# EasyEDA Pro project ProPrj_装配排查_2026-04-26.epro, schematic Schematic2
Assembly Variant: Basic; Board Name: Board2; Create Date: 2026-04-22; Page Name: P1; Project Name: 装配排查; Schematic Name: Schematic2; Update Date: 2026-04-22; Company: 嘉立创EDA; Page Size: A4; Version: V1.0
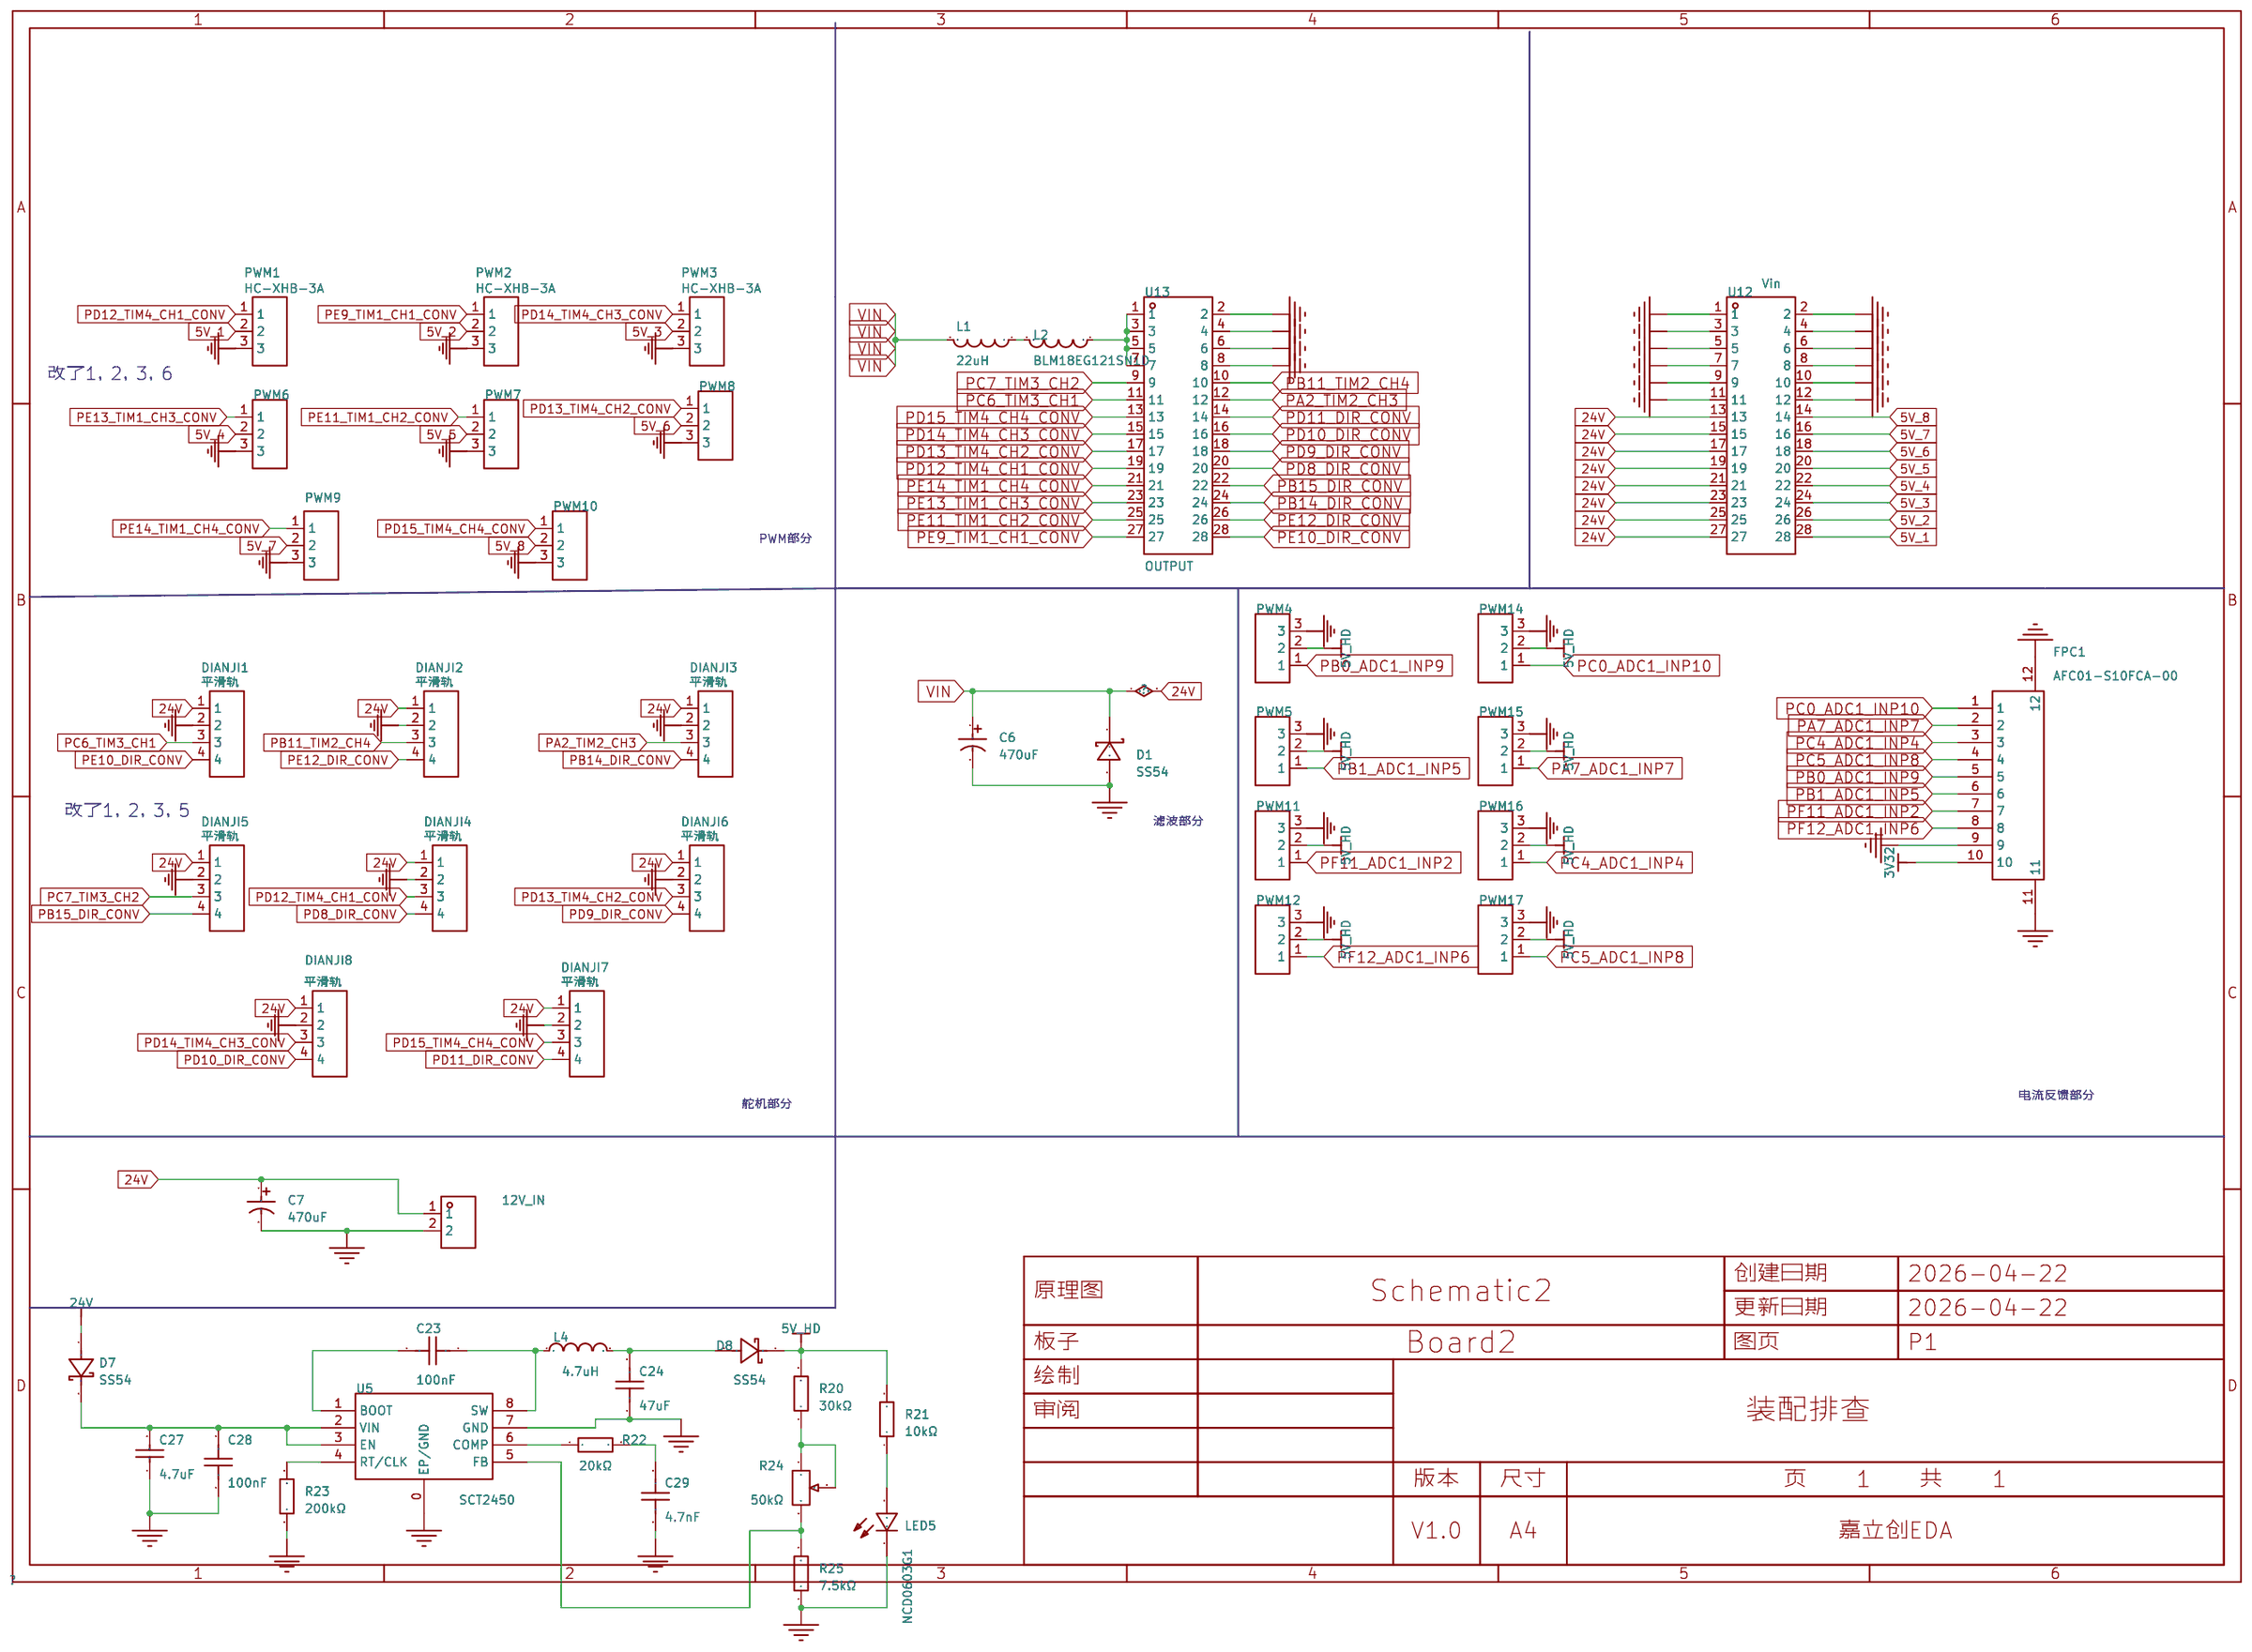
[diagram p0: schematic sheet]

## Parts
24V1  12V_IN  [CONN-TH_XY2500V-A-5.00-2P]
C6  470uF  [CAP-TH_BD10.0-P5.00-D1.0-FD]
C7  470uF  [CAP-TH_BD10.0-P5.00-D1.0-FD]
C23  100nF  [C0603]
C24  47uF  [C1206]
C27  4.7uF  [C1206]
C28  100nF  [C0603]
C29  4.7nF  [C0603]
D1  SS54  [SMA_L4.3-W2.6-LS5.2-RD]
D7  SS54  [SMA_L4.3-W2.6-LS5.0-FD]
D8  SS54  [SMA_L4.3-W2.6-LS5.0-FD]
DIANJI1  平滑轨  [CONN-TH_XY2500V-A-5.00-4P]
DIANJI2  平滑轨  [CONN-TH_XY2500V-A-5.00-4P]
DIANJI3  平滑轨  [CONN-TH_XY2500V-A-5.00-4P]
DIANJI4  平滑轨  [CONN-TH_XY2500V-A-5.00-4P]
DIANJI5  平滑轨  [CONN-TH_XY2500V-A-5.00-4P]
DIANJI6  平滑轨  [CONN-TH_XY2500V-A-5.00-4P]
DIANJI7  平滑轨  [CONN-TH_XY2500V-A-5.00-4P]
DIANJI8  平滑轨  [CONN-TH_XY2500V-A-5.00-4P]
FPC1  AFC01-S10FCA-00  [FPC-SMD_P0.5-10P_FGS-XJ-H2.0]
L1  22uH  [IND-SMD_L6.0-W5.2_SUMIDA_CDH53]
L2  BLM18EG121SN1D  [L0603]
L4  4.7uH  [IND-SMD_L7.0-W6.6]
LED5  NCD0603G1  [LED0603-RD_1]
PWM1  HC-XHB-3A  [CONN-TH_3P-P2.50_HC-XHB-3A]
PWM2  HC-XHB-3A  [CONN-TH_3P-P2.50_HC-XHB-3A]
PWM3  HC-XHB-3A  [CONN-TH_3P-P2.50_HC-XHB-3A]
PWM4  HC-XHB-3A  [CONN-TH_3P-P2.50_HC-XHB-3A]
PWM5  HC-XHB-3A  [CONN-TH_3P-P2.50_HC-XHB-3A]
PWM6  HC-XHB-3A  [CONN-TH_3P-P2.50_HC-XHB-3A]
PWM7  HC-XHB-3A  [CONN-TH_3P-P2.50_HC-XHB-3A]
PWM8  HC-XHB-3A  [CONN-TH_3P-P2.50_HC-XHB-3A]
PWM9  HC-XHB-3A  [CONN-TH_3P-P2.50_HC-XHB-3A]
PWM10  HC-XHB-3A  [CONN-TH_3P-P2.50_HC-XHB-3A]
PWM11  HC-XHB-3A  [CONN-TH_3P-P2.50_HC-XHB-3A]
PWM12  HC-XHB-3A  [CONN-TH_3P-P2.50_HC-XHB-3A]
PWM14  HC-XHB-3A  [CONN-TH_3P-P2.50_HC-XHB-3A]
PWM15  HC-XHB-3A  [CONN-TH_3P-P2.50_HC-XHB-3A]
PWM16  HC-XHB-3A  [CONN-TH_3P-P2.50_HC-XHB-3A]
PWM17  HC-XHB-3A  [CONN-TH_3P-P2.50_HC-XHB-3A]
R20  30kΩ  [R0603]
R21  10kΩ  [R0603]
R22  20kΩ  [R0603]
R23  200kΩ  [R0603]
R24  50kΩ  [RES-ADJ-TH_3P-L7.1-W6.9-P2.50-L_3362P]
R25  7.5kΩ  [R0603]
U5  STC2450  [SOP-8E]
U12  Vin  [HDR-TH_28P-P2.54-H-F-R2-C14-W8.5]
U13  OUTPUT  [HDR-TH_28P-P2.54-H-F-R2-C14-W8.5]

## Library data of the parts
24V1 = 12V_IN: Supplier: LCSC; Supplier Part: C505761; Manufacturer: XINLAIYA(新莱亚); Manufacturer Part: XY2500V-A-5.00-2P; JLCPCB Part Class: Extended Part
C6 C7 = ERS1HM471G20OT: 容值:470uF;精度:±20%;额定电压:50V;; LCSC Part Name: 470uF ±20% 50V; Supplier Part: C106666; Manufacturer: AISHI(艾华集团); Supplier Footprint: 插件,D10xL20mm; JLCPCB Part Class: 扩展库; Datasheet: https://atta.szlcsc.com/upload/public/pdf/source/20191015/C438940_4B8E60A742BB0AE40DDEF87A5C89089D.pdf; Supplier: LCSC; Tolerance: ±20%; Rated Voltage: 50V; Lead Spacing: 5mm; φD: 10mm; L: 20mm; Lifetime @ Temp: 7000hrs@105℃
C23 C28 = CGA0603X7R104K500JT: 容值:100nF;精度:±10%;额定电压:50V;材质(温度系数):X7R;; LCSC Part Name: 100nF ±10% 50V; Supplier Part: C6119867; Manufacturer: HRE(芯声); Supplier Footprint: 0603; JLCPCB Part Class: 扩展库; Datasheet: https://atta.szlcsc.com/upload/public/pdf/source/20250103/C44077DA9E7B3EFAE02F22B6D3D1CBC9.pdf; Supplier: LCSC; Tolerance: ±10%; Voltage Rating: 50V; Temperature Coefficient: X7R; Voltage Rated: 50V
C24 = HGC1206R5476M250NSPJ: 容值:47uF;精度:±20%;额定电压:25V;材质(温度系数):X5R;; LCSC Part Name: 47uF ±20% 25V; Supplier Part: C22367835; Manufacturer: Chinocera(华瓷); Supplier Footprint: 1206; JLCPCB Part Class: 扩展库; Datasheet: https://atta.szlcsc.com/upload/public/pdf/source/20240326/E6CB0DC43BB858B74F4352229FABFDCA.pdf; Supplier: LCSC; Tolerance: ±20%; Voltage Rated: 25V; Temperature Coefficient: X5R
C27 = CL31B475KBHNNNE: 容值:4.7uF;精度:±10%;额定电压:50V;材质(温度系数):X7R;; LCSC Part Name: 4.7uF ±10% 50V; Supplier Part: C51205; Manufacturer: SAMSUNG(三星); Supplier Footprint: 1206; JLCPCB Part Class: 扩展库; Datasheet: https://atta.szlcsc.com/upload/public/pdf/source/20160218/1457707763339.pdf; Supplier: LCSC; Tolerance: ±10%; Voltage Rated: 50V; Temperature Coefficient: X7R
C29 = CGA0603X7R472K500JT: 容值:4.7nF;精度:±10%;额定电压:50V;材质(温度系数):X7R;; LCSC Part Name: 4.7nF ±10% 50V; Supplier Part: C7503499; Manufacturer: HRE(芯声); Supplier Footprint: 0603; JLCPCB Part Class: 扩展库; Supplier: LCSC; Tolerance: ±10%; Voltage Rated: 50V; Temperature Coefficient: X7R
D1 = SS34_C8678: 二极管配置:独立式;正向压降(Vf):550mV@3A;直流反向耐压(Vr):40V;整流电流:3A;; LCSC Part Name: 电压:40V 电流:3A; Supplier Part: C8678; Manufacturer: MDD(辰达半导体); Supplier Footprint: SMA(DO-214AC); JLCPCB Part Class: 基础库; Datasheet: https://atta.szlcsc.com/upload/public/pdf/source/20240710/2118BB86FDDB2E0B294389AC1F3F65C8.pdf; Supplier: LCSC; Diode Configuration: 独立式; Forward Voltage (Vf@If): 550mV@3A; Reverse Voltage (Vr): 40V; Rectified Current: 3A; Reverse Leakage Current (Ir): 500uA@40V
D7 D8 = SS54_C7420369: 二极管配置:独立式;正向压降(Vf):550mV@5.0A;直流反向耐压(Vr):40V;整流电流:5A;; LCSC Part Name: 电压:40V 电流:5A; Supplier Part: C7420369; Manufacturer: 宏迦橙; Supplier Footprint: SMA(DO-214AC); JLCPCB Part Class: 扩展库; Datasheet: https://atta.szlcsc.com/upload/public/pdf/source/20230828/254C3882F8647358AD9F60DD73611B5E.pdf; Supplier: LCSC; Diode Configuration: 独立式; Forward Voltage (Vf@If): 550mV@5.0A; Reverse Voltage (Vr): 40V; Rectified Current: 5A; Reverse Leakage Current (Ir): 50uA@40V
DIANJI1-DIANJI8 = 平滑轨: Supplier: LCSC; Supplier Part: C505763; Manufacturer: XINLAIYA(新莱亚); Manufacturer Part: XY2500V-A-5.00-4P; JLCPCB Part Class: Extended Part
FPC1 = AFC01-S10FCA-00: 锁定特性:翻盖式;触点类型:下接;触点数量:10P;间距:0.5mm;安装类型:卧贴;; LCSC Part Name: 间距:0.5mm P数:10P 翻盖式 下接; Supplier Part: C262659; Manufacturer: JS(钜硕电子); Supplier Footprint: SMD,P=0.5mm,卧贴; JLCPCB Part Class: 扩展库; Datasheet: https://atta.szlcsc.com/upload/public/pdf/source/20190816/C413942_2A72D1AC756EAE17EEDF756A339D4500.pdf; Supplier: LCSC; Locking Feature: 翻盖式; Contact Type: 下接; Number of Contacts: 10P; Pitch: 0.5mm; Mounting Type: 卧贴; FFC, FCB Thickness: 0.3mm; Height Above Board: 2mm
L1 = PCR0530-220-M: 电感值:22uH;精度:±20%;额定电流:2A;饱和电流(Isat):2.5A;类型:一体成型电感;; LCSC Part Name: 22μH ±20% 2A; Supplier Part: C53896868; Manufacturer: JIERR(捷而瑞); Supplier Footprint: SMD,6x5.2mm; JLCPCB Part Class: Extended Part; Datasheet: https://item.szlcsc.com/datasheet/PCR0530-220-M/57092550.html; Supplier: LCSC; Tolerance: ±20%; Current Rating: 2A; Current - Saturation(Isat): 2.5A; DC Resistance(DCR): 260mΩ; Type: 一体成型电感
L2 = BLM18EG121SN1D: 阻抗@频率:120Ω@100MHz;误差:±25%;直流电阻(DCR):40mΩ;; LCSC Part Name: 单路 0603磁珠 阻抗120Ω@100MHz; Supplier Part: C882954; Manufacturer: muRata(村田); Supplier Footprint: 0603; JLCPCB Part Class: Extended Part; Datasheet: https://item.szlcsc.com/datasheet/BLM18EG121SN1D/948024.html; Supplier: LCSC; Impedance @ Frequency: 120Ω@100MHz; Tolerance: ±25%; DC Resistance(DCR): 40mΩ; Current Rating: 2A; Number of Circuits: 1; Operating Temperature: -55℃~+125℃
L4 = FXL0630-4R7-M: 电感值:4.7uH;精度:±20%;额定电流:6A;饱和电流(Isat):9A;类型:一体成型电感;; LCSC Part Name: 4.7uH ±20% 9A; Supplier Part: C167220; Manufacturer: cjiang(长江微电); Supplier Footprint: SMD,6.6x7mm; JLCPCB Part Class: 扩展库; Datasheet: https://atta.szlcsc.com/upload/public/pdf/source/20240426/3189EA8206330E2108542F9E34E540E7.pdf; Supplier: LCSC; Tolerance: ±20%; Rated Current: 6A; Saturation Current (Isat): 9A; DC Resistance (DCR): 33mΩ; Type: 一体成型电感
LED5 = NCD0603G1: 发光颜色:翠绿色;正向电压(VF):2.6V~3.6V;功率:72mW;正向电流:10mA;主波长:515nm~530nm;透镜颜色:无色透明透镜;发光强度:330mcd~900mcd;发光角度:130°;工作温度:-30℃~+85℃;; Supplier Part: C84267; Manufacturer: 国星光电; Supplier Footprint: 0603; JLCPCB Part Class: 扩展库; Datasheet: https://atta.szlcsc.com/upload/public/pdf/source/20200820/C84267_04BA7703640BAC111D09F5EFB971FBF3.pdf; Supplier: LCSC; Emitted Color: 翠绿色; Forward Voltage (VF): 2.6V~3.6V; Power Dissipation: 72mW; Forward Current: 10mA; Dominant Wavelength: 515nm~530nm; Lens Color: 无色透明透镜; Luminous Intensity: 330mcd~900mcd; Viewing Angle: 130°; Operating Temperature: -30℃~+85℃
PWM1-PWM12 PWM14-PWM17 = HC-XHB-3A: Supplier: LCSC; Supplier Part: C2845491; Manufacturer: HCTL(华灿天禄); JLCPCB Part Class: Extended Part
R20 = 0603WAF3002T5E: 电阻类型:厚膜电阻;阻值:30kΩ;精度:±1%;功率:100mW;最大工作电压:75V;温度系数:±100ppm/℃;; LCSC Part Name: 30kΩ ±1% 100mW 厚膜电阻; Supplier Part: C22984; Manufacturer: UNI-ROYAL(厚声); Supplier Footprint: 0603; JLCPCB Part Class: 基础库; Datasheet: https://atta.szlcsc.com/upload/public/pdf/source/20200306/C422600_1E6D84923E4A46A82E41ADD87F860B5C.pdf; Supplier: LCSC; Type: 厚膜电阻; Tolerance: ±1%; Power(Watts): 100mW; Overload Voltage (Max): 75V; Temperature Coefficient: ±100ppm/℃; Operating Temperature Range: -55℃~+155℃
R21 = 0603WAF1002T5E: 电阻类型:厚膜电阻;阻值:10kΩ;精度:±1%;功率:100mW;最大工作电压:75V;温度系数:±100ppm/℃;; LCSC Part Name: 厚膜电阻 10kΩ ±1% 100mW; Supplier Part: C25804; Manufacturer: UNI-ROYAL(厚声); Supplier Footprint: 0603; JLCPCB Part Class: 基础库; Datasheet: https://atta.szlcsc.com/upload/public/pdf/source/20200306/C422600_1E6D84923E4A46A82E41ADD87F860B5C.pdf; Supplier: LCSC; Type: 厚膜电阻; Tolerance: ±1%; Power(Watts): 100mW; Overload Voltage (Max): 75V; Temperature Coefficient: ±100ppm/℃; Operating Temperature Range: -55℃~+155℃
R22 = 0603WAF2002T5E: 电阻类型:厚膜电阻;阻值:20kΩ;精度:±1%;功率:100mW;最大工作电压:75V;温度系数:±100ppm/℃;; LCSC Part Name: 20kΩ ±1% 100mW 厚膜电阻; Supplier Part: C4184; Manufacturer: UNI-ROYAL(厚声); Supplier Footprint: 0603; JLCPCB Part Class: 基础库; Datasheet: https://atta.szlcsc.com/upload/public/pdf/source/20200306/C422600_1E6D84923E4A46A82E41ADD87F860B5C.pdf; Supplier: LCSC; Type: 厚膜电阻; Tolerance: ±1%; Power(Watts): 100mW; Overload Voltage (Max): 75V; Temperature Coefficient: ±100ppm/℃; Operating Temperature Range: -55℃~+155℃
R23 = 0603WAF2003T5E: 电阻类型:厚膜电阻;阻值:200kΩ;精度:±1%;功率:100mW;最大工作电压:75V;温度系数:±100ppm/℃;; LCSC Part Name: 200kΩ ±1% 100mW 厚膜电阻; Supplier Part: C25811; Manufacturer: UNI-ROYAL(厚声); Supplier Footprint: 0603; JLCPCB Part Class: 基础库; Datasheet: https://atta.szlcsc.com/upload/public/pdf/source/20200306/C422600_1E6D84923E4A46A82E41ADD87F860B5C.pdf; Supplier: LCSC; Type: 厚膜电阻; Tolerance: ±1%; Power(Watts): 100mW; Overload Voltage (Max): 75V; Temperature Coefficient: ±100ppm/℃; Operating Temperature Range: -55℃~+155℃
R24 = 3362P-1-503: 阻值:50kΩ;精度:±10%;; LCSC Part Name: 50kΩ ±10%; Supplier Part: C118910; Manufacturer: BOCHEN(博晨); Supplier Footprint: 插件; JLCPCB Part Class: 扩展库; Datasheet: https://atta.szlcsc.com/upload/public/pdf/source/20171114/C118910_15106326554621117400.pdf; Supplier: LCSC; Tolerance: ±10%
R25 = 0603WAF7501T5E: 电阻类型:厚膜电阻;阻值:7.5kΩ;精度:±1%;功率:100mW;最大工作电压:75V;温度系数:±100ppm/℃;; LCSC Part Name: 7.5kΩ ±1% 100mW 厚膜电阻; Supplier Part: C23234; Manufacturer: UNI-ROYAL(厚声); Supplier Footprint: 0603; JLCPCB Part Class: 基础库; Datasheet: https://atta.szlcsc.com/upload/public/pdf/source/20200306/C422600_1E6D84923E4A46A82E41ADD87F860B5C.pdf; Supplier: LCSC; Type: 厚膜电阻; Tolerance: ±1%; Power(Watts): 100mW; Overload Voltage (Max): 75V; Temperature Coefficient: ±100ppm/℃; Operating Temperature Range: -55℃~+155℃
U5 = STC2450: Revision: V1.0
U12 U13 = PM254-2-14-W-8.5: 插孔结构:2x14P;间距:2.54mm;行距:2.54mm;圆孔/方孔:方孔;安装类型:弯插;排数:双排;总孔位数:28P;额定电流:3A;额定电压:-;插孔方向:侧面;塑高:8.5mm;触头材质:铜合金;工作温度范围:-40℃~+105℃;焊接温度(最大值):260℃@5S;; LCSC Part Name: 2x14P 间距:2.54mm 弯插; Supplier Part: C2897434; Manufacturer: HCTL(华灿天禄); Supplier Footprint: 弯插,P=2.54mm; JLCPCB Part Class: 扩展库; Datasheet: https://atta.szlcsc.com/upload/public/pdf/source/20230609/283C0D22EF4E6FFE03D5A855876981ED.pdf; Supplier: LCSC; Holes Structure: 2x14P; Pitch: 2.54mm; Row Spacing: 2.54mm; Circular Hole / Square Hole: 方孔; Mounting Type: 弯插; Number of Rows: 双排; Number of Holes: 28P; Current Rating (Max): 3A; Holes Direction: 侧面; Insulation Height: 8.5mm; Contact Material: 铜合金; Operating Temperature Range: -40℃~+105℃; Soldering Temperature(Max): 260℃@5S

## Nets
3V32: FPC1.10
5V_1: PWM1.2 U12.28
5V_2: PWM2.2 U12.26
5V_3: PWM3.2 U12.24
5V_4: PWM6.2 U12.22
5V_5: PWM7.2 U12.20
5V_6: PWM8.2 U12.18
5V_7: PWM9.2 U12.16
5V_8: PWM10.2 U12.14
5V_HD: D8.2(K) PWM4.2 PWM5.2 PWM11.2 PWM12.2 PWM14.2 PWM15.2 PWM16.2 PWM17.2 R20.2 R21.2
24V: 24V1.1 C6.1 C7.1 D1.1(K) D7.1(A) DIANJI1.1 DIANJI2.1 DIANJI3.1 DIANJI4.1 DIANJI5.1 DIANJI6.1 DIANJI7.1 DIANJI8.1 L1.2 U12.13 U12.15 U12.17 U12.19 U12.21 U12.23 U12.25 U12.27
GND: 24V1.2 C6.2 C7.2 C24.1 C27.1 C28.1 C29.1 D1.2(A) DIANJI1.2 DIANJI2.2 DIANJI3.2 DIANJI4.2 DIANJI5.2 DIANJI6.2 DIANJI7.2 DIANJI8.2 FPC1.9 FPC1.11 FPC1.12 LED5.1(K) PWM1.3 PWM2.3 PWM3.3 PWM4.3 PWM5.3 PWM6.3 PWM7.3 PWM8.3 PWM9.3 PWM10.3 PWM11.3 PWM12.3 PWM14.3 PWM15.3 PWM16.3 PWM17.3 R23.1 R25.1 U5.0(EP/GND) U5.7(GND) U12.1 U12.2 U12.3 U12.4 U12.5 U12.6 U12.7 U12.8 U12.9 U12.10 U12.11 U12.12 U13.2 U13.4 U13.6 U13.8
PA2_TIM2_CH3: DIANJI3.3 U13.12
PA7_ADC1_INP7: FPC1.2 PWM15.1
PB0_ADC1_INP9: FPC1.5 PWM4.1
PB1_ADC1_INP5: FPC1.6 PWM5.1
PB11_TIM2_CH4: DIANJI2.3 U13.10
PB14_DIR_CONV: DIANJI3.4 U13.24
PB15_DIR_CONV: DIANJI5.4 U13.22
PC0_ADC1_INP10: FPC1.1 PWM14.1
PC4_ADC1_INP4: FPC1.3 PWM16.1
PC5_ADC1_INP8: FPC1.4 PWM17.1
PC6_TIM3_CH1: DIANJI1.3 U13.11
PC7_TIM3_CH2: DIANJI5.3 U13.9
PD8_DIR_CONV: DIANJI4.4 U13.20
PD9_DIR_CONV: DIANJI6.4 U13.18
PD10_DIR_CONV: DIANJI8.4 U13.16
PD11_DIR_CONV: DIANJI7.4 U13.14
PD12_TIM4_CH1_CONV: DIANJI4.3 PWM1.1 U13.19
PD13_TIM4_CH2_CONV: DIANJI6.3 PWM8.1 U13.17
PD14_TIM4_CH3_CONV: DIANJI8.3 PWM3.1 U13.15
PD15_TIM4_CH4_CONV: DIANJI7.3 PWM10.1 U13.13
PE9_TIM1_CH1_CONV: PWM2.1 U13.27
PE10_DIR_CONV: DIANJI1.4 U13.28
PE11_TIM1_CH2_CONV: PWM7.1 U13.25
PE12_DIR_CONV: DIANJI2.4 U13.26
PE13_TIM1_CH3_CONV: PWM6.1 U13.23
PE14_TIM1_CH4_CONV: PWM9.1 U13.21
PF11_ADC1_INP2: FPC1.7 PWM11.1
PF12_ADC1_INP6: FPC1.8 PWM12.1
$1N152: LED5.2(A) R21.1
$1N155: C29.2 R22.2
$1N156: R22.1 U5.6(COMP)
$1N157: R24.3 R25.2 U5.5(FB)
$1N158: R20.1 R24.1 R24.2
$1N161: C24.2 D8.1(A) L4.2
$1N162: C23.1 L4.1 U5.8(SW)
$1N163: C23.2 U5.1(BOOT)
$1N167: C27.2 C28.2 D7.2(K) U5.2(VIN) U5.3(EN)
$1N170: R23.2 U5.4(RT/CLK)
$1N222: L1.1 L2.2
$1N224: L2.1 U13.1 U13.3 U13.5 U13.7

## Notes on the sheet
- 改了1，2，3，6
- PWM部分
- 改了1，2，3，5
- 滤波部分
- 电流反馈部分
- 舵机部分
